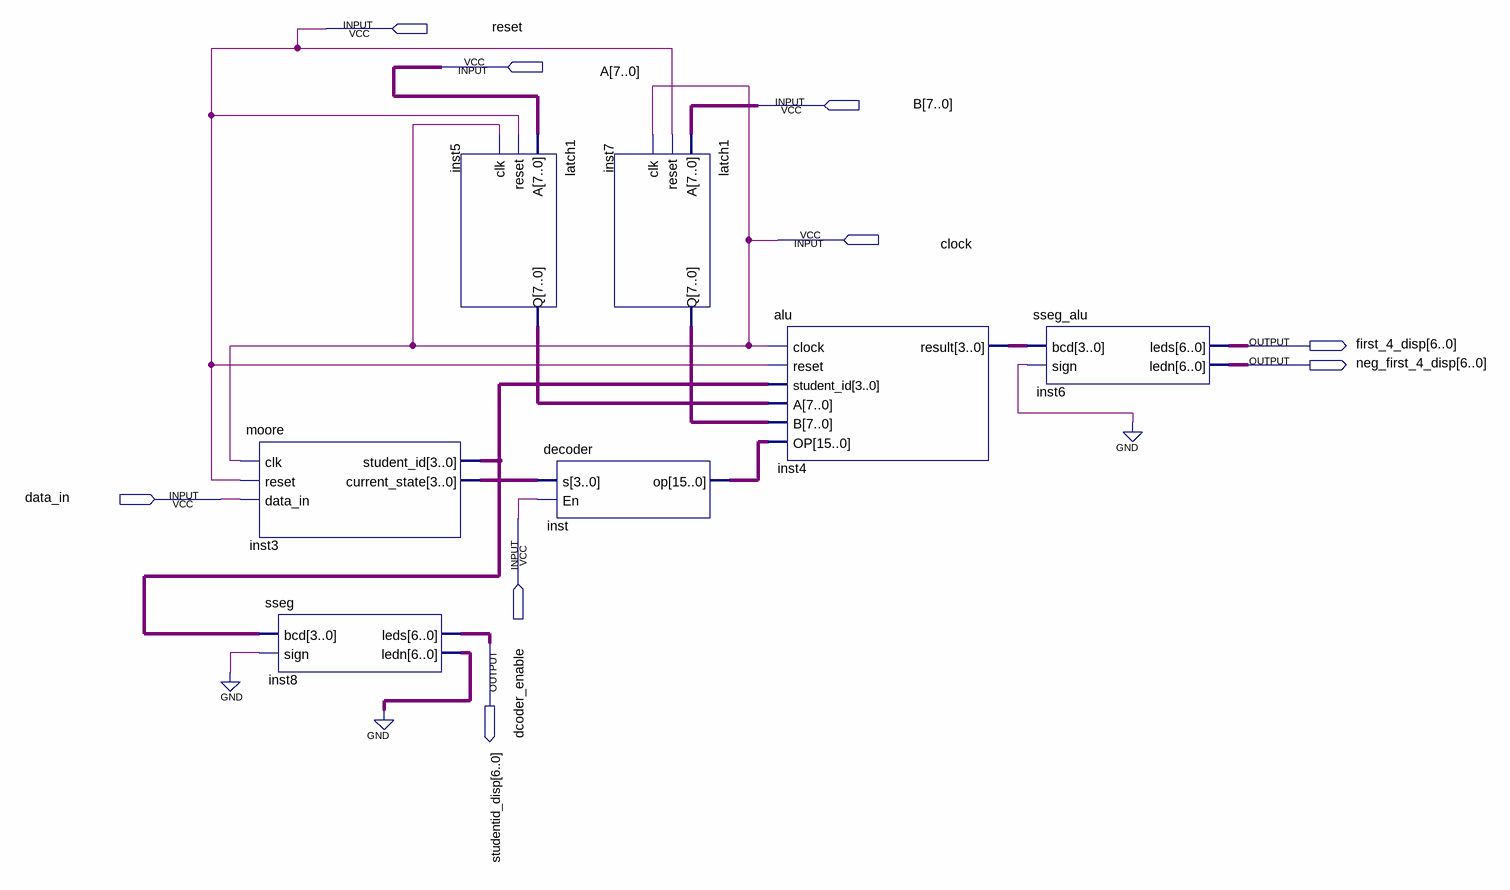
[diagram p0: schematic sheet]
// Quartus schematic alu_diag.bdf as structural Verilog: 7 symbols, 9 pins
module alu_diag (
  input  reset,
  input  [7:0] A,
  input  [7:0] B,
  input  clock,
  input  data_in,
  input  dcoder_enable,
  output [6:0] first_4_disp,
  output [6:0] neg_first_4_disp,
  output [6:0] studentid_disp
);

  wire [3:0] inst3_current_state, inst3_student_id, inst4_result;
  wire [6:0] inst8_ledn;
  wire [7:0] inst5_q, inst7_q;
  wire [15:0] inst_op;

  moore inst3 (
    .clk(clock), .reset(reset), .data_in(data_in), .student_id(inst3_student_id),
    .current_state(inst3_current_state));
  sseg inst8 (.bcd(inst3_student_id), .sign(1'b0), .leds(studentid_disp), .ledn(inst8_ledn));
  latch1 inst5 (.A(A), .reset(reset), .clk(clock), .Q(inst5_q));
  decoder inst (.s(inst3_current_state), .En(dcoder_enable), .op(inst_op));
  latch1 inst7 (.A(B), .reset(reset), .clk(clock), .Q(inst7_q));
  alu inst4 (
    .clock(clock), .reset(reset), .student_id(inst3_student_id), .A(inst5_q), .B(inst7_q), .OP(inst_op),
    .result(inst4_result));
  sseg_alu inst6 (.bcd(inst4_result), .sign(1'b0), .leds(first_4_disp), .ledn(neg_first_4_disp));
  // also tied to GND on the sheet: {inst8_ledn[0], inst8_ledn[1], inst8_ledn[2], inst8_ledn[3], inst8_ledn[4], inst8_ledn[5], inst8_ledn[6]}
endmodule
